# EasyEDA Pro project ProDocument_总线舵机驱动板_2025-06-14.epro

# Schematic Schematic6
Create Date: 2025-05-27; Page Name: P1; Project Name: 25电赛备赛; Schematic Name: Schematic6; Update Date: 2025-06-09; Company: 嘉立创EDA; Page Size: A4; Version: V1.0
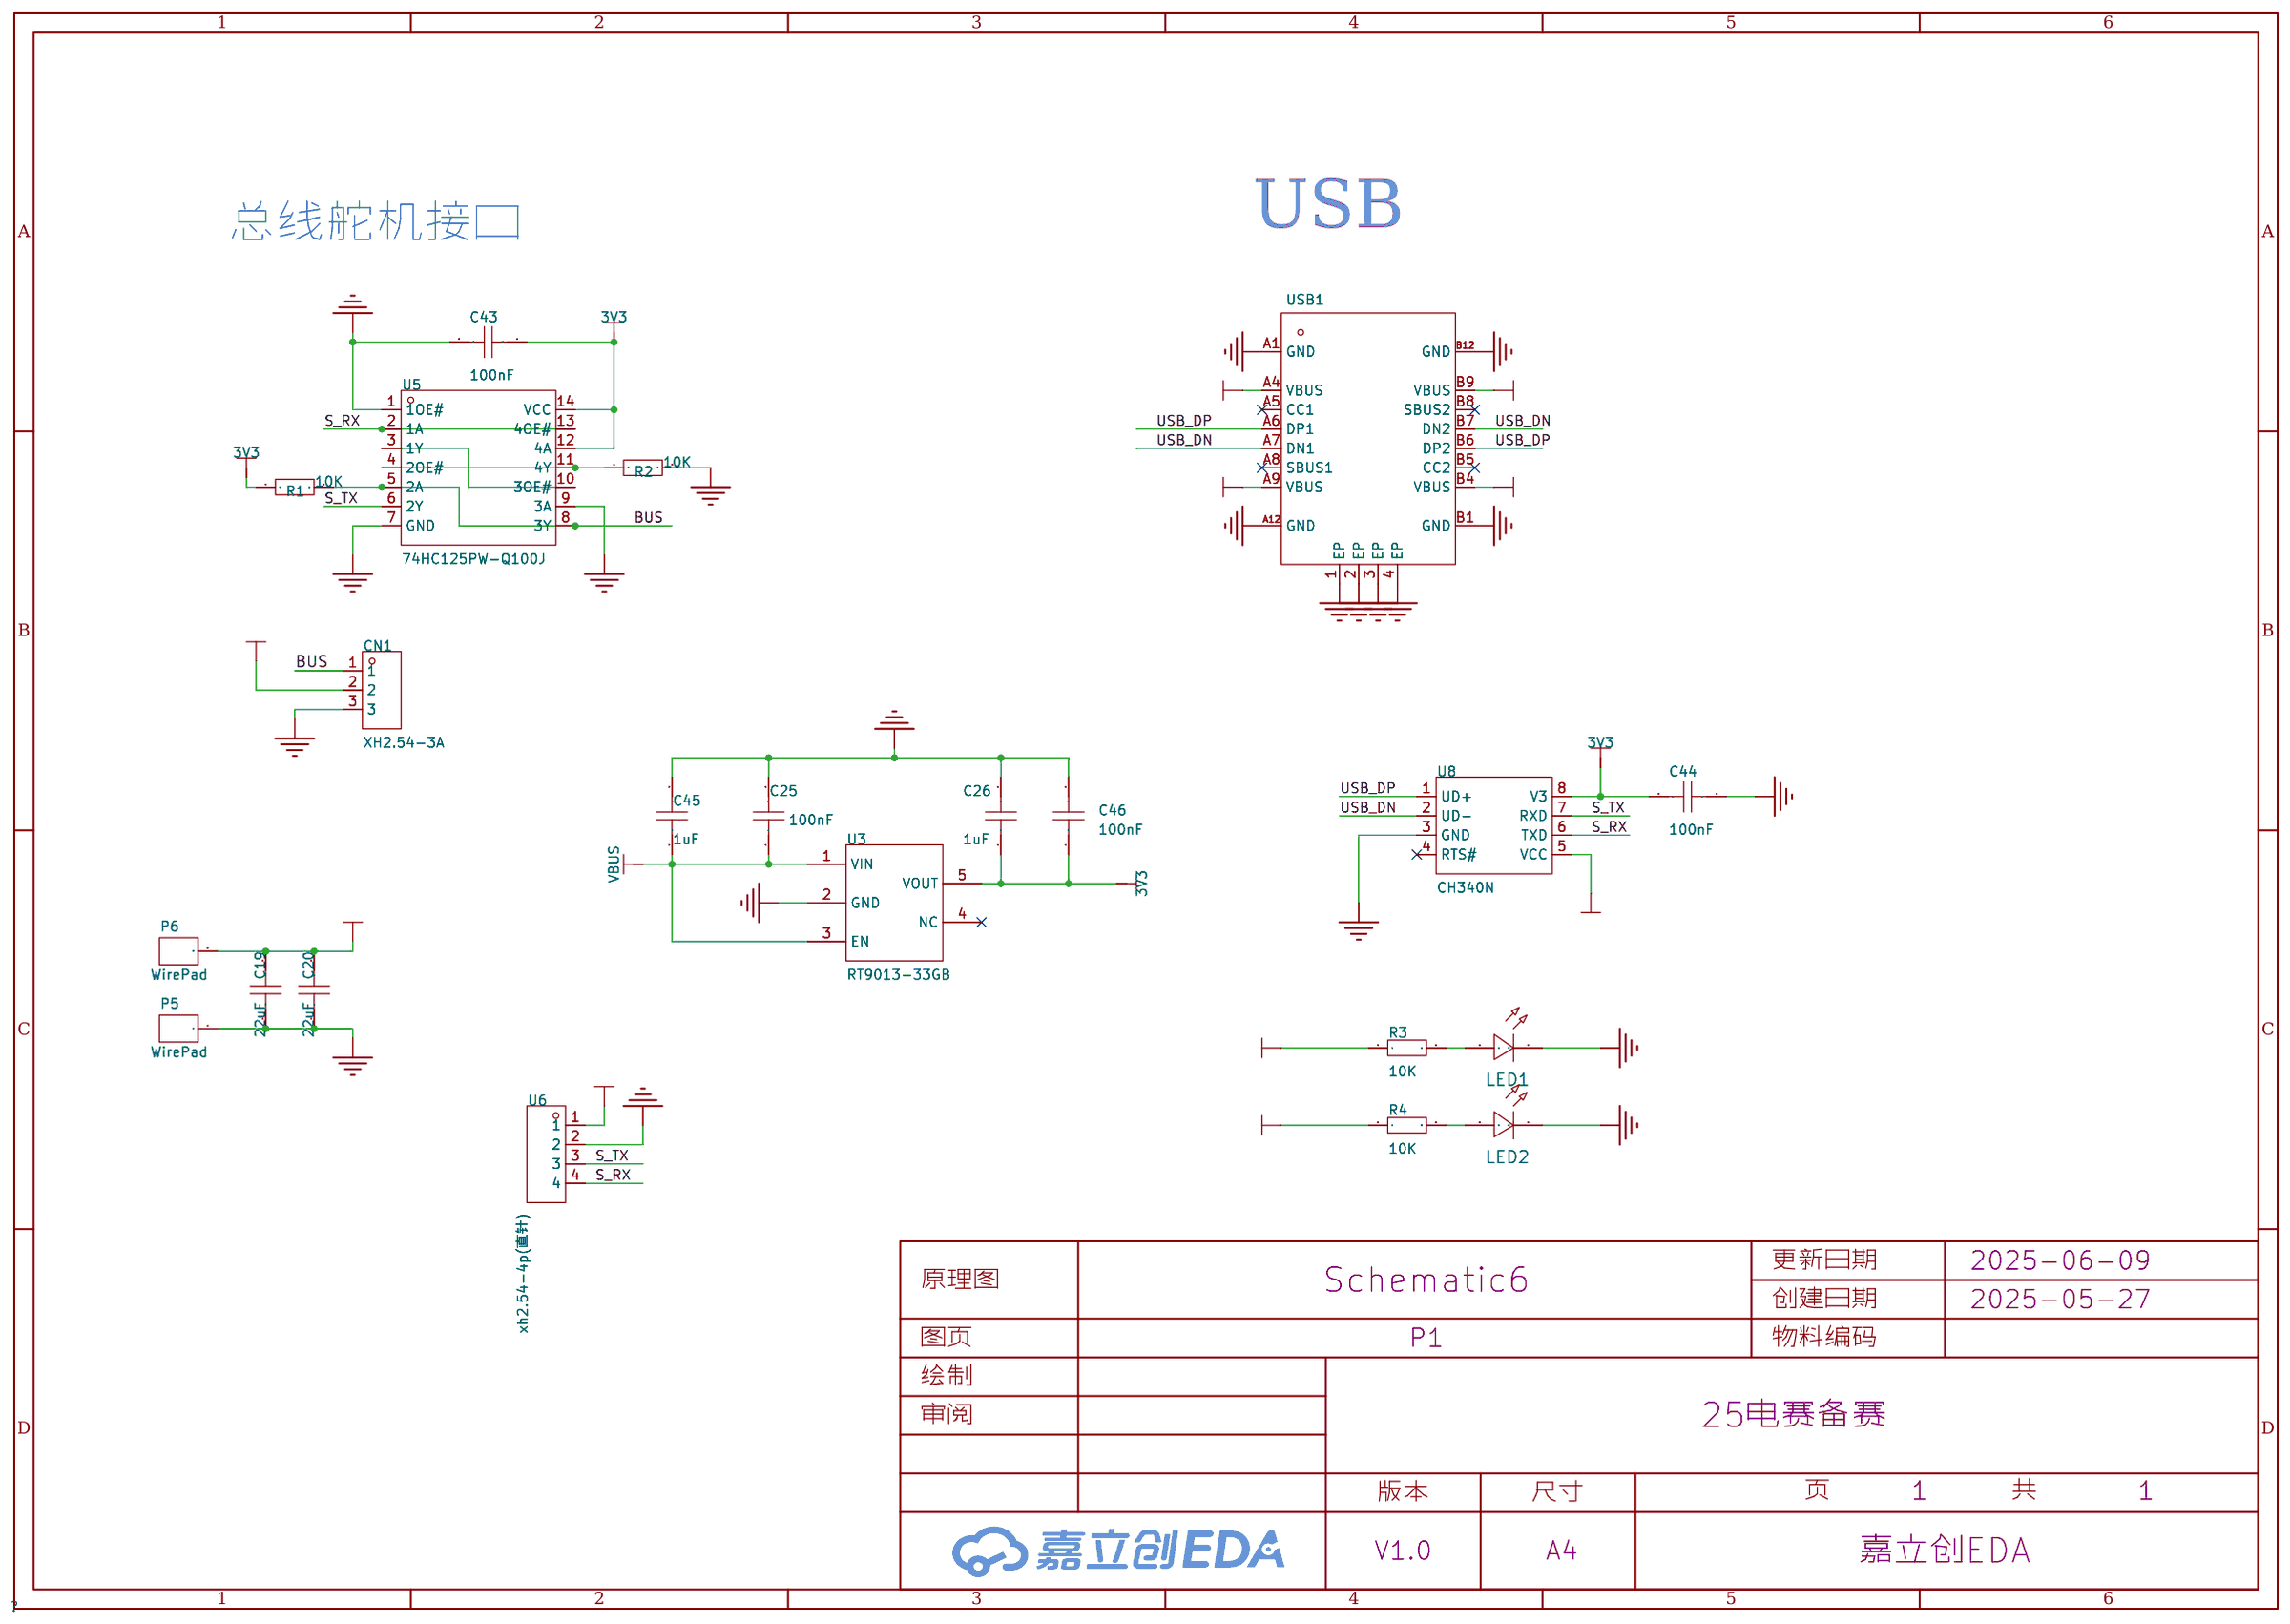
[diagram p0: schematic sheet]

## Parts
C19  22uF  [capc2012[0805]s-n]
C20  22uF  [capc2012[0805]s-n]
C25  100nF  [C0603]
C26  1uF  [C0603]
C43  100nF  [C0603]
C44  100nF  [C0603]
C45  1uF  [C0603]
C46  100nF  [C0603]
CN1  XH2.54-3A  [CONN-TH_3P-P2.50_HCTL_XH-3A-L]
LED1  -  [LED_0603]
LED2  -  [LED_0603]
P5  WirePad  [WirePad-4x6]
P6  WirePad  [WirePad-4x6]
R1  10K  [R0603]
R2  10K  [R0603]
R3  10K  [R0603]
R4  10K  [R0603]
U3  RT9013-33GB  [SOT-23-5_L3.0-W1.7-P0.95-LS2.8-BL]
U5  74HC125PW-Q100J  [TSSOP-14_L5.0-W4.4-P0.65-LS6.4-BL]
U6  xh2.54-4p(直针)  [CONN-TH_4P-P2.50-XH2.54-4P]
U8  CH340N  [SOP-8_L4.9-W3.9-P1.27-LS6.0-BL]
USB1  -  [USB_TYPE-C-16P]

## Library data of the parts
C19 C20 = CAP_0805: Supplier Footprint: 0805
C25 C26 C43-C46 = CAP_0603: Supplier Footprint: 0603
CN1 = XH2.54-3A: Supplier Part: C9900018379; JLCPCB Part Class: 扩展库; Supplier: LCSC
LED1 LED2 = LED_0603-R: Supplier Footprint: 0603
P5 P6 = WirePad: Origin Footprint 2: WirePad-4.5x7
R1-R4 = Res_0603: Supplier Footprint: 0603
U3 = RT9013-33GB: 输出类型:固定;最大输入电压:5.5V;输出电压:3.3V;最大输出电流:500mA;电源纹波抑制比(PSRR):50dB@(10kHz);输出极性:正极;; LCSC Part Name: 输入5.5V 输出3.3V 500mA; Supplier Part: C47773; Manufacturer: RICHTEK(立锜); Supplier Footprint: SOT-23-5; JLCPCB Part Class: 扩展库; Datasheet: https://atta.szlcsc.com/upload/public/pdf/source/20150504/1457707282459.pdf; Supplier: LCSC; Output Type: 固定; Maximum Input Voltage: 5.5V; Output Voltage: 3.3V; MAX Output Current: 500mA; Power Supply Rejection Ratio (PSRR): 50dB@(10kHz); Dropout Voltage: 400mV@(500mA); standby current: 50uA; Operating Temperature: -40℃~+85℃; Output Polarity: 正极; Number of Outputs: 1
U5 = 74HC125PW-Q100J: 输入类型:-;电源电压:2V~6V;元件数:4;每个元件位数:1;灌电流(IOL):7.8mA;拉电流(IOH):7.8mA;; Supplier Part: C546556; Manufacturer: Nexperia(安世); Supplier Footprint: TSSOP-14; JLCPCB Part Class: 扩展库; Datasheet: https://atta.szlcsc.com/upload/public/pdf/source/20240724/DDF56EDCDAD151F6D08E65E33D02F29B.pdf; Supplier: LCSC; output type: 三态; Supply Voltage: 2V~6V; Number of Elements: 4; Number of Bits per Element: 1; Sink Current: 7.8mA; Source Current: 7.8mA; Logic Family: 74HC; Operating Temperature: -40℃~+125℃
U6 = xh2.54-4p(直针): Supplier Part: C9900015350; JLCPCB Part Class: 扩展库; Supplier: LCSC
U8 = CH340N: 应用功能:USB转串口;接口协议:USB 2.0;通道数:1;数据速率:2Mbps;; LCSC Part Name: USB2.0芯片CH340; Supplier Part: C2977777; Manufacturer: WCH(南京沁恒); Supplier Footprint: SOP-8; JLCPCB Part Class: 扩展库; Datasheet: https://atta.szlcsc.com/upload/public/pdf/source/20240313/115CDE92081B1D6CB446704AD5D0F5F2.pdf; Supplier: LCSC; Applications Function: USB转串口; Protocol: USB 2.0; Number of Channels: 1; Voltage - Supply: 3.3V；5V; Data Rate: 2Mbps; Operating Temperature: -20℃~+70℃
USB1 = USB_TYPE-C-16P: Supplier Footprint: SMD

## Nets
3V3: C26.1 C43.1 C44.1 C46.1 R1.1 R3.1 U3.5(VOUT) U5.12(4A) U5.14(VCC) U6.1 U8.5(VCC) U8.8(V3)
GND: C19.1 C20.1 C25.2 C26.2 C43.2 C44.2 C45.2 C46.2 CN1.3 LED1.1(C) LED2.1(C) P5.1 R2.2 U3.2(GND) U5.1(1OE#) U5.7(GND) U5.9(3A) U6.2 U8.3(GND) USB1.1(EP) USB1.2(EP) USB1.3(EP) USB1.4(EP) USB1.A1(GND) USB1.A12(GND) USB1.B1(GND) USB1.B12(GND)
PVCC: C19.2 C20.2 CN1.2 P6.1 R4.1
VBUS: C25.1 C45.1 U3.1(VIN) U3.3(EN) USB1.A4(VBUS) USB1.A9(VBUS) USB1.B4(VBUS) USB1.B9(VBUS)
BUS: CN1.1 R1.2 U5.5(2A) U5.8(3Y)
S_RX: U5.2(1A) U5.13(4OE#) U6.4 U8.6(TXD)
S_TX: U5.6(2Y) U6.3 U8.7(RXD)
USB_DN: U8.2(UD-) USB1.A7(DN1) USB1.B7(DN2)
USB_DP: U8.1(UD+) USB1.A6(DP1) USB1.B6(DP2)
$1N348: U5.3(1Y) U5.10(3OE#)
$1N351: R2.1 U5.4(2OE#) U5.11(4Y)
$1N1470: LED1.2(A) R3.2
$1N1496: LED2.2(A) R4.2

Not connected (* = marked no-connect by the designer): U3 4(NC)*; U8 4(RTS#)*; USB1 A5(CC1)* A8(SBUS1)* B5(CC2)* B8(SBUS2)*

## Notes on the sheet
- 总线舵机接口
- USB

# Board PCB31
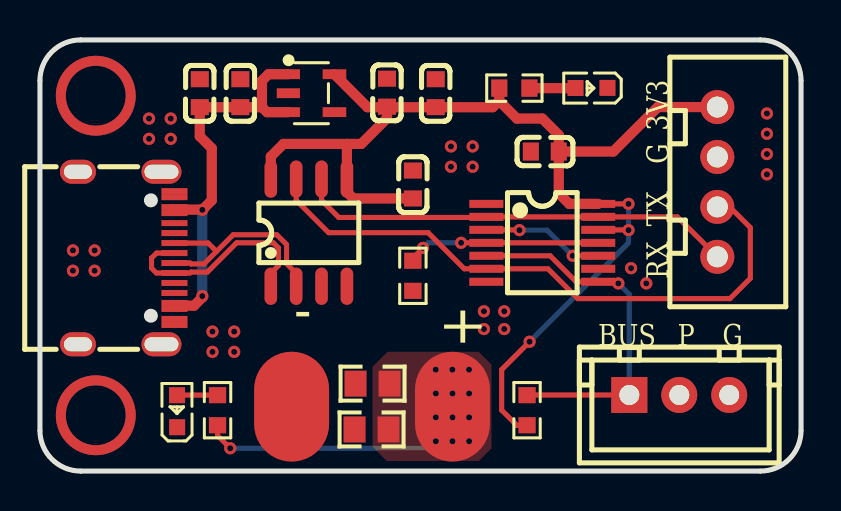
[diagram p1: board, top side]
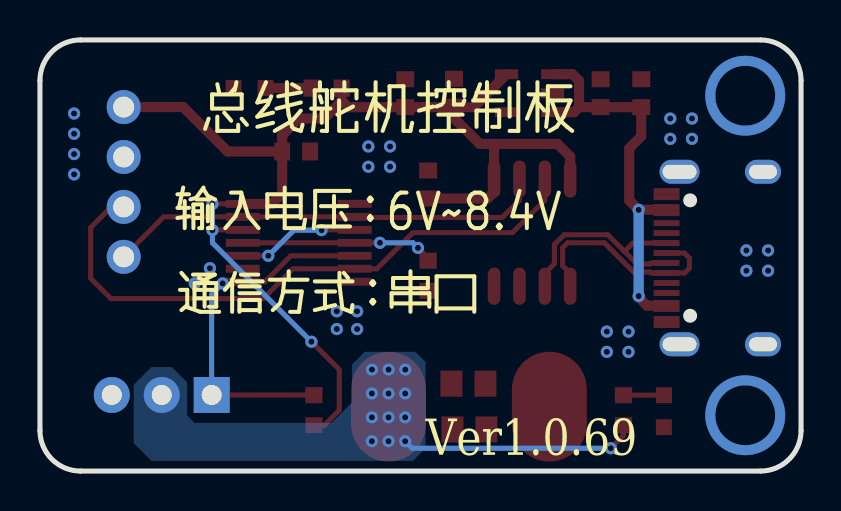
[diagram p2: board, bottom side, seen from below]

Outline 38.1 x 21.59 mm; copper layers: Top Layer, Bottom Layer. Coordinates in mm from the lower left corner of the outline.
Outline path: 0,19.56 0,2.03 arc(0.6,0.6) 2.03,0 36.07,0 arc(37.5,0.6) 38.1,2.03 38.1,19.56 arc(37.5,20.99) 36.07,21.59 2.03,21.59 arc(0.6,20.99) 0,19.56
Stack: Top Layer 0.035mm / Dielectric1 1.51mm FR4 er 4.5 / Bottom Layer 0.035mm

## Design rules (mm)
net USB_DP: DP1
net USB_DN: DP1
template: JLCPCB Capability(Two Layers Board)
spacing copperThickness1oz (default): track to track 0.102, other pairs 0.152 to 0.3
spacing copperThickness2oz: track to track 0.203, other pairs 0.152 to 0.3
track width copperThickness1oz (default): min 0.127, default 0.254, max 2.54
track width copperThickness2oz: min 0.203, default 0.254, max 2.54
differential pair differentialPair (default): width min 0.127, default 0.254, max 2.54; gap min 0.152, default 0.152
via viaSize (default): diameter min 0.5, default 0.61, max 10; hole min 0.3, default 0.305, max 6.3

## Placement (name value [footprint] x y rotation side)
C19  22uF  [capc2012[0805]s-n]  16.65 4.38 0 top
C20  22uF  [capc2012[0805]s-n]  16.6 2.08 0 top
C25  100nF  [C0603]  10.03 18.92 90 top
C26  1uF  [C0603]  17.37 18.95 90 top
C43  100nF  [C0603]  25.27 16 180 top
C44  100nF  [C0603]  18.67 14.35 90 top
C45  1uF  [C0603]  8 18.92 90 top
C46  100nF  [C0603]  19.81 18.92 90 top
CN1  XH2.54-3A  [CONN-TH_3P-P2.50_HCTL_XH-3A-L]  32 3.81 180 top
LED1  -  [LED_0603]  27.56 19.18 180 top
LED2  -  [LED_0603]  6.86 3.05 90 top
P5  WirePad  [WirePad-4x6]  12.6 3.23 270 top
P6  WirePad  [WirePad-4x6]  20.65 3.23 270 top
R1  10K  [R0603]  24.38 3.05 90 top
R2  10K  [R0603]  18.67 9.78 270 top
R3  10K  [R0603]  23.75 19.18 0 top
R4  10K  [R0603]  8.89 3.05 90 top
U3  RT9013-33GB  [SOT-23-5_L3.0-W1.7-P0.95-LS2.8-BL]  13.59 18.92 270 top
U5  74HC125PW-Q100J  [TSSOP-14_L5.0-W4.4-P0.65-LS6.4-BL]  25.15 11.43 270 top
U6  xh2.54-4p(直针)  [CONN-TH_4P-P2.50-XH2.54-4P]  33.91 14.48 90 top
U8  CH340N  [SOP-8_L4.9-W3.9-P1.27-LS6.0-BL]  13.46 11.94 0 top
USB1  -  [USB_TYPE-C-16P]  4.32 10.8 270 top

## Footprints (pads in the part's own frame, mm; a bottom-side part is the same pattern mirrored in y, then rotated)
C0603
  rect 0.8x0.9 smd: 1(-0.7,0) 2(0.7,0)
capc2012[0805]s-n
  rect 1.1x1.3 smd: 1(-0.85,0) 2(0.85,0)
CONN-TH_3P-P2.50_HCTL_XH-3A-L
  rect 1.8x1.8 hole 1: 1(2.5,0)
  round 1.8 hole 1: 2(0,0) 3(-2.5,0)
CONN-TH_4P-P2.50-XH2.54-4P
  round 1.7 hole 1.05: 1(3.75,0) 2(1.25,0) 3(-1.25,0) 4(-3.75,0)
LED_0603
  rect 0.8x0.8 smd: 1(-0.851,-0.01) 2(0.75,-0.005)
R0603
  rect 0.806x0.864 smd: 1(-0.753,0) 2(0.753,0)
SOP-8_L4.9-W3.9-P1.27-LS6.0-BL
  oval 0.63x1.865 smd: 1(-1.905,-2.683) 2(-0.635,-2.683) 3(0.635,-2.683) 4(1.905,-2.683) 5(1.905,2.683) 6(0.635,2.683) 7(-0.635,2.683) 8(-1.905,2.683)
SOT-23-5_L3.0-W1.7-P0.95-LS2.8-BL
  rect 0.49x1.157 smd: 1(-0.95,-1.153) 2(0,-1.153) 3(0.95,-1.153)
  rect 0.49x1.175 smd: 4(0.95,1.153) 5(-0.95,1.153)
TSSOP-14_L5.0-W4.4-P0.65-LS6.4-BL
  rect 0.4x1.7 smd: 1(-1.95,-2.8) 2(-1.3,-2.8) 3(-0.65,-2.8) 4(0,-2.8) 5(0.65,-2.8) 6(1.3,-2.8) 7(1.95,-2.8) 8(1.95,2.8) 9(1.3,2.8) 10(0.65,2.8) 11(0,2.8) 12(-0.65,2.8) 13(-1.3,2.8) 14(-1.95,2.8)
USB_TYPE-C-16P
  oval 1.2x2 hole 0.7x1.7: 1(-4.193,1.765) 2(4.447,1.765)
  oval 1.2x1.8 hole 0.7x1.4: 3(-4.193,-2.415) 4(4.447,-2.415)
  rect 0.3x1.3 smd: A1(-3.223,2.415) A4(-2.423,2.415) A5(-1.123,2.415) A6(-0.123,2.415) A7(0.377,2.415) A8(1.377,2.415) A9(2.677,2.415) A12(3.477,2.415) B1(3.177,2.415) B4(2.377,2.415) B5(1.877,2.415) B6(0.877,2.415) B7(-0.623,2.415) B8(-1.623,2.415) B9(-2.123,2.415) B12(-2.923,2.415)
WirePad-4x6
  rrect 5.5x3.75 smd: 1(0,0)

## Nets
As in the schematic.

Pads without a net: U3 4; U8 4; USB1 A5 A8 B5 B8

## Via types
v1: diameter 4, hole 3, Top Layer to Bottom Layer, 2 vias
v2: diameter 0.61, hole 0.305, Top Layer to Bottom Layer, 49 vias

## Routing (per net, layer and track width the routed paths; a pad name or vN(x,y) marks a point on that pad's centre or on a via; arc(x,y) is an arc through that point)
3V3: length 59.1
  Top Layer w0.254: v2(29.46,13.38) U5.14 ; R1.1 23.87,2.29 23.11,3.05 23.11,5.08 v2(24.51,6.48) ; v2(29.46,12.06) 29.45,12.08 U5.12
  Top Layer w0.508: 23,18.55 23,18.53 23.88,17.65 25.15,17.65 25.97,16.83 C43.1 ; 23,18.55 R3.1 ; 23,18.55 22.67,18.22 C46.1 17.37,18.22 ; C43.1 28.7,16 30.93,18.23 U6.1 ; C43.1 25.97,13.91 26.5,13.38 U5.14 ; U8.8 11.56,15.75 12.19,16.38 15.37,16.38 ; 15.37,16.38 U8.5 15.37,13.97 15.69,13.65 C44.1 ; 15.37,16.38 16.09,16.38 17.37,17.67 17.37,18.22 ; U3.5 16.39,18.22 17.37,18.22 ; 17.37,18.22 17.37,18.25
  Bottom Layer w0.254: v2(29.46,13.38) v2(29.46,12.06) 29.46,11.43 v2(24.51,6.48)
GND:
  vias: v2(1.65,11.05) v2(1.65,10.03) v2(2.74,11.05) v2(2.74,10.03) v2(5.46,17.65) v2(5.46,16.64) v2(6.55,17.65) v2(6.55,16.64) v2(8.64,6.98) v2(8.64,5.97) v2(9.72,6.98) v2(9.72,5.97) v2(20.57,16.26) v2(20.57,15.24) v2(21.66,16.26) v2(21.66,15.24) v2(22.22,8) v2(22.22,7.11) v2(23.24,8) v2(23.24,7.11) v2(29.59,10.16) v2(30.35,9.4) v2(36.39,17.91) v2(36.39,16.89) v2(36.39,15.88) v2(36.39,14.86)
PVCC: length 11.9
  Top Layer w0.254: R4.1 8.89,1.78 v2(9.53,1.14)
  Bottom Layer w0.254: v2(9.53,1.14) 19.47,1.14 v2(19.82,1.49)
  vias: v2(19.81,5.08) v2(19.82,3.89) v2(19.82,2.69) v2(20.65,5.08) v2(20.65,3.89) v2(20.65,2.69) v2(20.65,1.49) v2(21.48,5.08) v2(21.49,3.89) v2(21.49,2.69) v2(21.49,1.49)
VBUS: length 20.3
  Top Layer w0.508: 11.11,18.22 C25.1 C45.1 8,16.76 8.6,16.16 8.6,13.56 8.14,13.09 6.63,13.09 ; 11.11,18.22 11.36,17.97 U3.3 ; 11.11,18.22 11.11,19.55 11.44,19.87 U3.1 ; v2(8.13,8.76) 8.13,8.7 7.71,8.28 6.74,8.28
  Bottom Layer w0.508: v2(8.13,8.76) v2(8.13,13.08)
(no net):
  vias: v1(2.79,18.8) v1(2.79,2.79)
BUS: length 18.1
  Top Layer w0.254: R1.2 24.39,3.81 CN1.1 ; U5.5 25.54,10.78 26.84,9.48 U5.8 28.87,9.48 v2(28.96,9.4)
  Bottom Layer w0.254: CN1.1 29.5,8.85 v2(28.96,9.4)
S_RX: length 22.1
  Top Layer w0.254: U8.6 14.1,13.56 14.96,12.7 22.32,12.7 U5.2 U5.13 31.91,12.73 U6.4
S_TX: length 30.9
  Top Layer w0.254: U8.7 12.83,13.56 14.45,11.94 19.43,11.94 21.24,10.13 U5.6 25.43,10.13 26.92,8.64 34.54,8.64 35.56,9.65 35.56,12.19 34.52,13.23 U6.3
USB_DN: length 11
  Top Layer w0.254: 8.84,11 8.42,11.42 USB1.B7 ; 8.84,11 9.68,11.84 11.85,11.84 12.34,11.34 12.34,10.39 12.83,9.91 U8.2 ; 8.84,11 8.21,10.37 7.56,10.37 7.51,10.42 USB1.A7
USB_DP: length 11
  Top Layer w0.254: U8.1 11.56,9.91 11.94,10.29 11.94,11.18 11.68,11.43 9.85,11.43 8.38,9.97 7.56,9.97 7.51,9.92 USB1.B6 5.83,9.92 5.59,10.16 5.59,10.67 5.84,10.92 USB1.A6
$1N348: length 6.1
  Top Layer w0.254: U5.10 v2(26.67,10.78) ; U5.3 23.99,12.08 v2(24,12.06)
  Bottom Layer w0.254: v2(26.67,10.78) 25.38,12.06 v2(24,12.06)
$1N351: length 9.7
  Top Layer w0.254: v2(19.18,11.18) 18.67,10.67 R2.1 ; v2(21.08,11.43) U5.4 U5.11
  Bottom Layer w0.254: v2(21.08,11.43) 19.43,11.43 v2(19.18,11.18)
$1N1470: length 2.3
  Top Layer w0.508: LED1.2 26.8,19.18 R3.2
$1N1496: length 2
  Top Layer w0.254: LED2.2 6.87,3.8 R4.2

## Copper pours and planes (outline as drawn; the poured copper is in the pictures)
GND on Top Layer: -2.41,24.77 43.18,24.77 43.18,-2.92 -2.41,-2.92
GND on Bottom Layer: -1.14,23.5 39.12,23.5 39.12,-3.17 -1.14,-3.17
PVCC on Top Layer: 16.65,5.97 22.61,5.97 22.61,0.51 16.65,0.51
PVCC on Bottom Layer: 18.8,5.97 33.4,5.97 33.4,0.51 18.8,0.51

## Text on the board
Bottom Silkscreen Layer: Ver1.0.69 | 通信方式：串口 | 输入电压：6V~8.4V | 总线舵机控制板
Top Silkscreen Layer: - | + | BUS | P | G | 3V3 | TX | RX
